# Altium project DT10965_MOTOR_CONTROLLER.PrjPcb (part 3 of 8)

## Sheet Accelerometers.SchDoc: =DT_SCH_Title
size A4; Organization: Droid Technologies; DocumentNumber: DT10965; Revision: 1.0; SheetNumber: 9; SheetTotal: 22
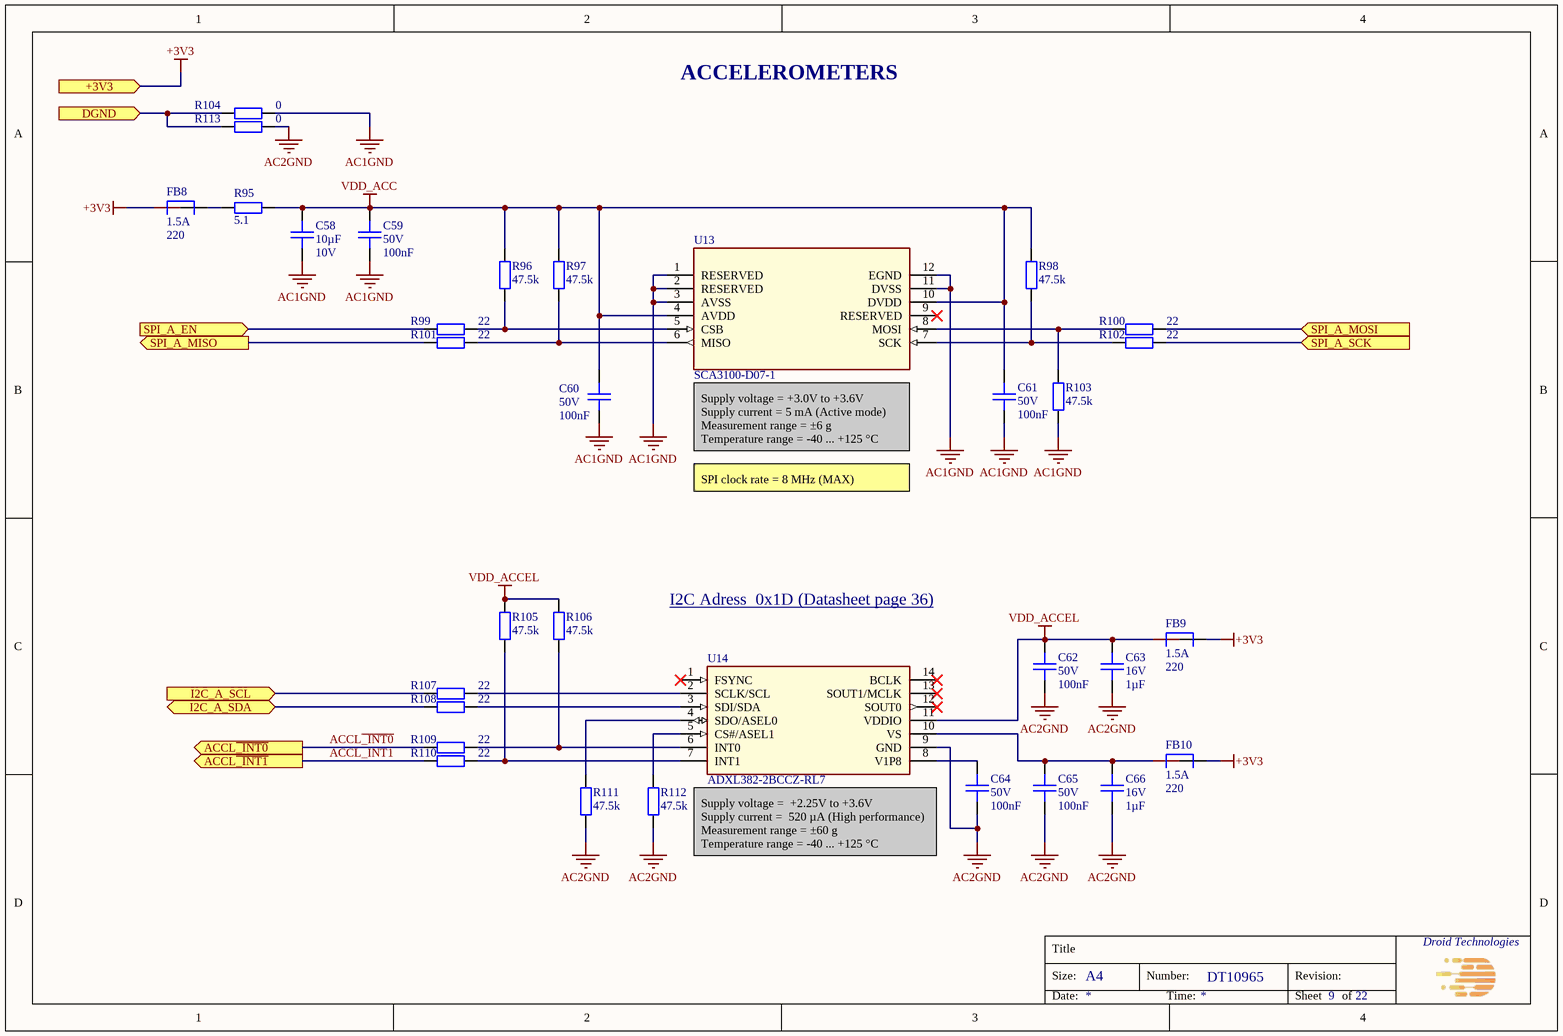
[diagram p7: Accelerometers.SchDoc]

### Parts
C58  Capacitance: 10µF  Voltage Rating: 10V  [CAPC200X125X145L50]  (hidden comment: CGA4J1X8L1A106K125AC)
C59  Voltage Rating: 50V  Capacitance: 100nF  [CAPC100x50x50L25]  (hidden comment: GCM155L8EH104KE07D)
C60  Voltage Rating: 50V  Capacitance: 100nF  [CAPC100x50x50L25]  (hidden comment: GCM155L8EH104KE07D)
C61  Voltage Rating: 50V  Capacitance: 100nF  [CAPC100x50x50L25]  (hidden comment: GCM155L8EH104KE07D)
C62  Voltage Rating: 50V  Capacitance: 100nF  [CAPC100x50x50L25]  (hidden comment: GCM155L8EH104KE07D)
C63  Voltage Rating: 16V  Capacitance: 1µF  [CAPC160X80X90L35]  (hidden comment: GCG188L8EE105KA07D)
C64  Voltage Rating: 50V  Capacitance: 100nF  [CAPC100x50x50L25]  (hidden comment: GCM155L8EH104KE07D)
C65  Voltage Rating: 50V  Capacitance: 100nF  [CAPC100x50x50L25]  (hidden comment: GCM155L8EH104KE07D)
C66  Voltage Rating: 16V  Capacitance: 1µF  [CAPC160X80X90L35]  (hidden comment: GCG188L8EE105KA07D)
FB8  Imax: 1.5A  Impedance: 220  [BEADC160X80X95L40]  (hidden comment: BLM18KG221BH1D)
FB9  Imax: 1.5A  Impedance: 220  [BEADC160X80X95L40]  (hidden comment: BLM18KG221BH1D)
FB10  Imax: 1.5A  Impedance: 220  [BEADC160X80X95L40]  (hidden comment: BLM18KG221BH1D)
R95  Resistance: 5.1  [RESC100X50X40L25]  (hidden comment: RC0402FR-075R1L)
R96  Resistance: 47.5k  [RESC100X50X40L25]  (hidden comment: RC0402FR-0747K5L)
R97  Resistance: 47.5k  [RESC100X50X40L25]  (hidden comment: RC0402FR-0747K5L)
R98  Resistance: 47.5k  [RESC100X50X40L25]  (hidden comment: RC0402FR-0747K5L)
R99  Resistance: 22  [RESC100X50X40L25]  (hidden comment: RC0402FR-0722RL)
R100  Resistance: 22  [RESC100X50X40L25]  (hidden comment: RC0402FR-0722RL)
R101  Resistance: 22  [RESC100X50X40L25]  (hidden comment: RC0402FR-0722RL)
R102  Resistance: 22  [RESC100X50X40L25]  (hidden comment: RC0402FR-0722RL)
R103  Resistance: 47.5k  [RESC100X50X40L25]  (hidden comment: RC0402FR-0747K5L)
R104  Resistance: 0  [RESC160X80X55L30]  (hidden comment: RC0603FR-070RL)
R105  Resistance: 47.5k  [RESC100X50X40L25]  (hidden comment: RC0402FR-0747K5L)
R106  Resistance: 47.5k  [RESC100X50X40L25]  (hidden comment: RC0402FR-0747K5L)
R107  Resistance: 22  [RESC100X50X40L25]  (hidden comment: RC0402FR-0722RL)
R108  Resistance: 22  [RESC100X50X40L25]  (hidden comment: RC0402FR-0722RL)
R109  Resistance: 22  [RESC100X50X40L25]  (hidden comment: RC0402FR-0722RL)
R110  Resistance: 22  [RESC100X50X40L25]  (hidden comment: RC0402FR-0722RL)
R111  Resistance: 47.5k  [RESC100X50X40L25]  (hidden comment: RC0402FR-0747K5L)
R112  Resistance: 47.5k  [RESC100X50X40L25]  (hidden comment: RC0402FR-0747K5L)
R113  Resistance: 0  [RESC160X80X55L30]  (hidden comment: RC0603FR-070RL)
U13  SCA3100-D07-1  [SCA3100-D07-1]
U14  ADXL382-2BCCZ-RL7  [14-LGA (2.9x2.8)]

### Ports
+3V3 (in), ACCL~{_INT0} (out), ACCL~{_INT1} (out), DGND (in), I2C_A_SCL (in), I2C_A_SDA (bidir), SPI_A_EN (in), SPI_A_MISO (out), SPI_A_MOSI (in), SPI_A_SCK (in)

### Nets
+3V3: FB8.1 FB9.2 FB10.2 ; port +3V3
AC1GND: C58.1 C59.1 C60.1 C61.1 R103.1 R104.1 U13.1(RESERVED) U13.2(RESERVED) U13.3(AVSS) U13.11(DVSS) U13.12(EGND)
AC2GND: C62.1 C63.1 C64.1 C65.1 C66.1 R111.1 R112.1 R113.1 U14.9(GND)
DGND: R104.2 R113.2 ; port DGND
VDD_ACC: C58.2 C59.2 C60.2 C61.2 R95.2 R96.2 R97.2 R98.2 U13.4(AVDD) U13.10(DVDD)
VDD_ACCEL: C62.2 C63.2 FB9.1 R105.2 R106.2 U14.11(VDDIO)
ACCL~{_INT0}: R109.1 ; port ACCL~{_INT0}
ACCL~{_INT1}: R110.1 ; port ACCL~{_INT1}
I2C_A_SCL: R107.1 ; port I2C_A_SCL
I2C_A_SDA: R108.1 ; port I2C_A_SDA
SPI_A_EN: R99.1 ; port SPI_A_EN
SPI_A_MISO: R101.1 ; port SPI_A_MISO
SPI_A_MOSI: R100.2 ; port SPI_A_MOSI
SPI_A_SCK: R102.2 ; port SPI_A_SCK
NetC64_2: C64.2 U14.8(V1P8)
NetC65_2: C65.2 C66.2 FB10.1 U14.10(VS)
NetFB8_2: FB8.2 R95.1
NetR96_1: R96.1 R99.2 U13.5(CSB)
NetR97_1: R97.1 R101.2 U13.6(MISO)
NetR98_1: R98.1 R102.1 U13.7(SCK)
NetR100_1: R100.1 R103.2 U13.8(MOSI)
NetR105_1: R105.1 R110.2 U14.7(INT1)
NetR106_1: R106.1 R109.2 U14.6(INT0)
NetR107_2: R107.2 U14.2(SCLK/SCL)
NetR108_2: R108.2 U14.3(SDI/SDA)
NetR111_2: R111.2 U14.4(SDO/ASEL0)
NetR112_2: R112.2 U14.5(CS#/ASEL1)

Not connected (* = marked no-connect by the designer): U13 9(RESERVED)*; U14 1(FSYNC)* 12(SOUT0)* 13(SOUT1/MCLK)* 14(BCLK)*

### Notes on the sheet
- ACCELEROMETERS
- (near U13) Supply voltage = +3.0V to +3.6V
  Supply current = 5 mA (Active mode)
  Measurement range = ±6 g
  Temperature range = -40 ... +125 °C
- SPI clock rate = 8 MHz (MAX)
- I2C Adress  0x1D (Datasheet page 36) <https://www.analog.com/media/en/technical-documentation/data-sheets/adxl382.pdf>
- Supply voltage =  +2.25V to +3.6V
  Supply current =  520 µA (High performance)
  Measurement range = ±60 g
  Temperature range = -40 ... +125 °C
- Title
- Size:
- A4
- Number:
- Revision:
- Date:
- Time:
- Sheet
- of

### Library data of the parts
C58 = CMP-001-1984-2: CAP CER 10UF 10V X8L 0805; Manufacturer: TDK Corporation; Tolerance: 10%; Op Temp min: -55°C; Op Temp max: 150°C; ComponentLink3Description: Digikey; Mounting Type: SM; Ratings: AEC-Q200; ComponentLink1Description: Datasheet; ComponentLink3URL: https://www.digikey.com/en/products/detail/tdk-corporation/CGA4J1X8L1A106K125AC/9991388; Lead Spacing: 0mm; MPN: CGA4J1X8L1A106K125AC; Size: 2.00mm x 1.25mm; Height max: 1.5mm; ComponentLink2URL: https://eu.mouser.com/ProductDetail/TDK/CGA4J1X8L1A106K125AC?qs=gZXFycFWdANzH%252B2UvJJjtQ%3D%3D; Package: 0805 (2012 Metric); ComponentLink2Description: Mouser; Dielectric: X8L; ComponentLink1URL: https://product.tdk.com/en/search/capacitor/ceramic/mlcc/info?part_no=CGA4J1X8L1A106K125AC
C59-C62 C64 C65 = CMP-001-1980-2: CAP CER 0.1UF 50V X8L 0402; Manufacturer: Murata Electronics; Op Temp max: 150°C; Op Temp min: -55°C; Tolerance: 10%; Height max: 550µm; ComponentLink3Description: Digikey; Mounting Type: SM; ComponentLink3URL: https://www.digikey.com/en/products/detail/murata-electronics/GCM155L8EH104KE07D/11618823; Package: 0402 (1005 Metric); Lead Spacing: 0mm; MPN: GCM155L8EH104KE07D; Size: 1.00mm x 0.50mm; Ratings: AEC-Q200; ComponentLink1URL: https://www.murata.com/en-us/products/productdetail?partno=GCM155L8EH104KE07%23; ComponentLink1Description: Datasheet; Dielectric: X8L; ComponentLink2Description: Mouser; ComponentLink2URL: https://eu.mouser.com/ProductDetail/Murata-Electronics/GCM155L8EH104KE07D?qs=1mbolxNpo8fQSHf0HYnZWw%3D%3D
C63 C66 = CMP-001-1982-2: CAP CER 1UF 16V X8L 0603; Manufacturer: Murata Electronics; Tolerance: 10%; Op Temp min: -55°C; Op Temp max: 150°C; ComponentLink3URL: https://www.digikey.com/en/products/detail/murata-electronics/GCG188L8EE105KA07D/10695125; Package: 0603 (1608 Metric); MPN: GCG188L8EE105KA07D; ComponentLink2URL: https://eu.mouser.com/ProductDetail/Murata-Electronics/GCG188L8EE105KA07D?qs=rrS6PyfT74dFMfTR80dVTA%3D%3D; Dielectric: X8L; Size: 1.60mm x 0.80mm; ComponentLink1Description: Datasheet; ComponentLink1URL: https://www.murata.com/en-us/products/productdetail?partno=GCG188L8EE105KA07%23; ComponentLink2Description: Mouser; Height max: 900µm; Mounting Type: SM; ComponentLink3Description: Digikey; Lead Spacing: 0mm; Ratings: AEC-Q200
FB8-FB10 = CMP-001-1981-1: FERRITE BEAD 220 OHM 0603 1LN; Manufacturer: Murata Electronics; DCR: 50m; Op Temp min: -55°C; Frequency: 100MHz; Op Temp max: 150°C; Number of Lines: 1; Mounting Type: SM; Size: 1.60mm x 0.80mm; ComponentLink2URL: https://eu.mouser.com/ProductDetail/Murata-Electronics/BLM18KG221BH1D?qs=sJ5gq5MLFXpgEHYBdWUtkQ%3D%3D; ComponentLink1Description: Datasheet; ComponentLink1URL: https://www.murata.com/en-us/products/productdata/8798137286686/QNFA9129.pdf; Lead Spacing: 0mm; Ratings: AEC-Q200; ComponentLink3Description: Digikey; ComponentLink3URL: https://www.digikey.com/en/products/detail/murata-electronics/BLM18KG221BH1D/6156000; Height max: 950µm; Package: 0603 (1608 Metric); ComponentLink2Description: Mouser; MPN: BLM18KG221BH1D
R95 = CMP-00125-8: RES 5.1 OHM 1% 1/16W 0402; Manufacturer: YAGEO; Power: 63mW; Temperature Coefficient: ±200ppm; Op Temp max: 155°C; Op Temp min: -55°C; ComponentLink3URL: https://www.digikey.com/en/products/detail/yageo/RC0402FR-075R1L/5917722; ComponentLink2Description: Mouser; ComponentLink2URL: https://eu.mouser.com/ProductDetail/YAGEO/RC0402FR-075R1L?qs=%2Fha2pyFaduhjtLcYvKXQ8B9EFTm6YmMloHxcmTFokS12j5yrT26S1A%3D%3D; Size: 1.00mm x 0.50mm; ComponentLink3Description: Digikey; Package: 0402 (1005 Metric); Ratings: -; Tolerance: 1%; MPN: RC0402FR-075R1L; ComponentLink1URL: https://www.yageo.com/upload/media/product/productsearch/datasheet/rchip/PYu-RC_Group_51_RoHS_L_12.pdf; Mounting Type: SM; Composition: Thick Film; Height max: 400µm; ComponentLink1Description: Datasheet
R96-R98 R103 R105 R106 R111 R112 = CMP-001-0277-7: RES 47.5K OHM 1% 1/16W 0402; Manufacturer: YAGEO; Op Temp min: -55°C; Power: 63mW; Temperature Coefficient: ±100ppm; Op Temp max: 155°C; ComponentLink1URL: https://www.yageo.com/upload/media/product/productsearch/datasheet/rchip/PYu-RC_Group_51_RoHS_L_12.pdf; ComponentLink1Description: Datasheet; MPN: RC0402FR-0747K5L; ComponentLink3Description: Digikey; ComponentLink2URL: https://eu.mouser.com/ProductDetail/YAGEO/RC0402FR-0747K5L?qs=V1yeUXFNrklfu86Rfgihxg%3D%3D; Mounting Type: SM; Tolerance: 1%; Package: 0402 (1005 Metric); Height max: 400µm; ComponentLink2Description: Mouser; ComponentLink3URL: https://www.digikey.com/en/products/detail/yageo/RC0402FR-0747K5L/726617; Size: 1.00mm x 0.50mm; Composition: Thick Film; Ratings: -
R99-R102 R107-R110 = CMP-001-0482-4: RES 22 OHM 1% 1/16W 0402; Manufacturer: YAGEO; Temperature Coefficient: ±100ppm; Op Temp max: 155°C; Op Temp min: -55°C; Power: 63mW; Ratings: -; ComponentLink3URL: https://www.digikey.com/en/products/detail/yageo/RC0402FR-0722RL/726562; ComponentLink2URL: https://eu.mouser.com/ProductDetail/YAGEO/RC0402FR-0722RL?qs=V1yeUXFNrkkRg6zf08ADKQ%3D%3D; MPN: RC0402FR-0722RL; ComponentLink1Description: Datasheet; ComponentLink3Description: Digikey; Tolerance: 1%; Size: 1.00mm x 0.50mm; ComponentLink1URL: https://www.yageo.com/upload/media/product/productsearch/datasheet/rchip/PYu-RC_Group_51_RoHS_L_12.pdf; Composition: Thick Film; ComponentLink2Description: Mouser; Mounting Type: SM; Package: 0402 (1005 Metric); Height max: 400µm
R104 R113 = CMP-001-0927-2: RES 0 OHM JUMPER 1/10W 0603; Manufacturer: YAGEO; Op Temp min: -55°C; Op Temp max: 155°C; Power: 100mW; Tolerance: 0%; Height max: 550µm; ComponentLink2URL: https://eu.mouser.com/ProductDetail/YAGEO/RC0603FR-070RL?qs=0yPvnVz5%2FmpDQv43TwvCfw%3D%3D; Temperature Coefficient: -; ComponentLink3Description: Digikey; ComponentLink2Description: Mouser; MPN: RC0603FR-070RL; ComponentLink1URL: https://www.yageo.com/upload/media/product/productsearch/datasheet/rchip/PYu-RC_Group_51_RoHS_L_12.pdf; Ratings: -; Size: 1.60mm x 0.80mm; Composition: Thick Film; Mounting Type: SM; ComponentLink3URL: https://www.digikey.com/en/products/detail/yageo/RC0603FR-070RL/1304008; Package: 0603 (1608 Metric); ComponentLink1Description: Datasheet
U13 = SCA3100-D07-1: ACCELEROMETER 6G SPI 12SMD; Manufacturer: Murata Electronics; MPN: SCA3100-D07-1
U14 = ADXL382-2BCCZ-RL7: Accelerometer X, Y, Z Axis ±15g, 30g, 60g 50Hz ~ 8kHz 14-LGA (2.9x2.8); Manufacturer: Analog Devices Inc.; MPN: ADXL382-2BCCZ-RL7

## Sheet H-bridge.SchDoc: =DT_SCH_Title
size A4; Organization: Droid Technologies; DocumentNumber: DT10965; Revision: 1.0; SheetNumber: 10; SheetTotal: 22
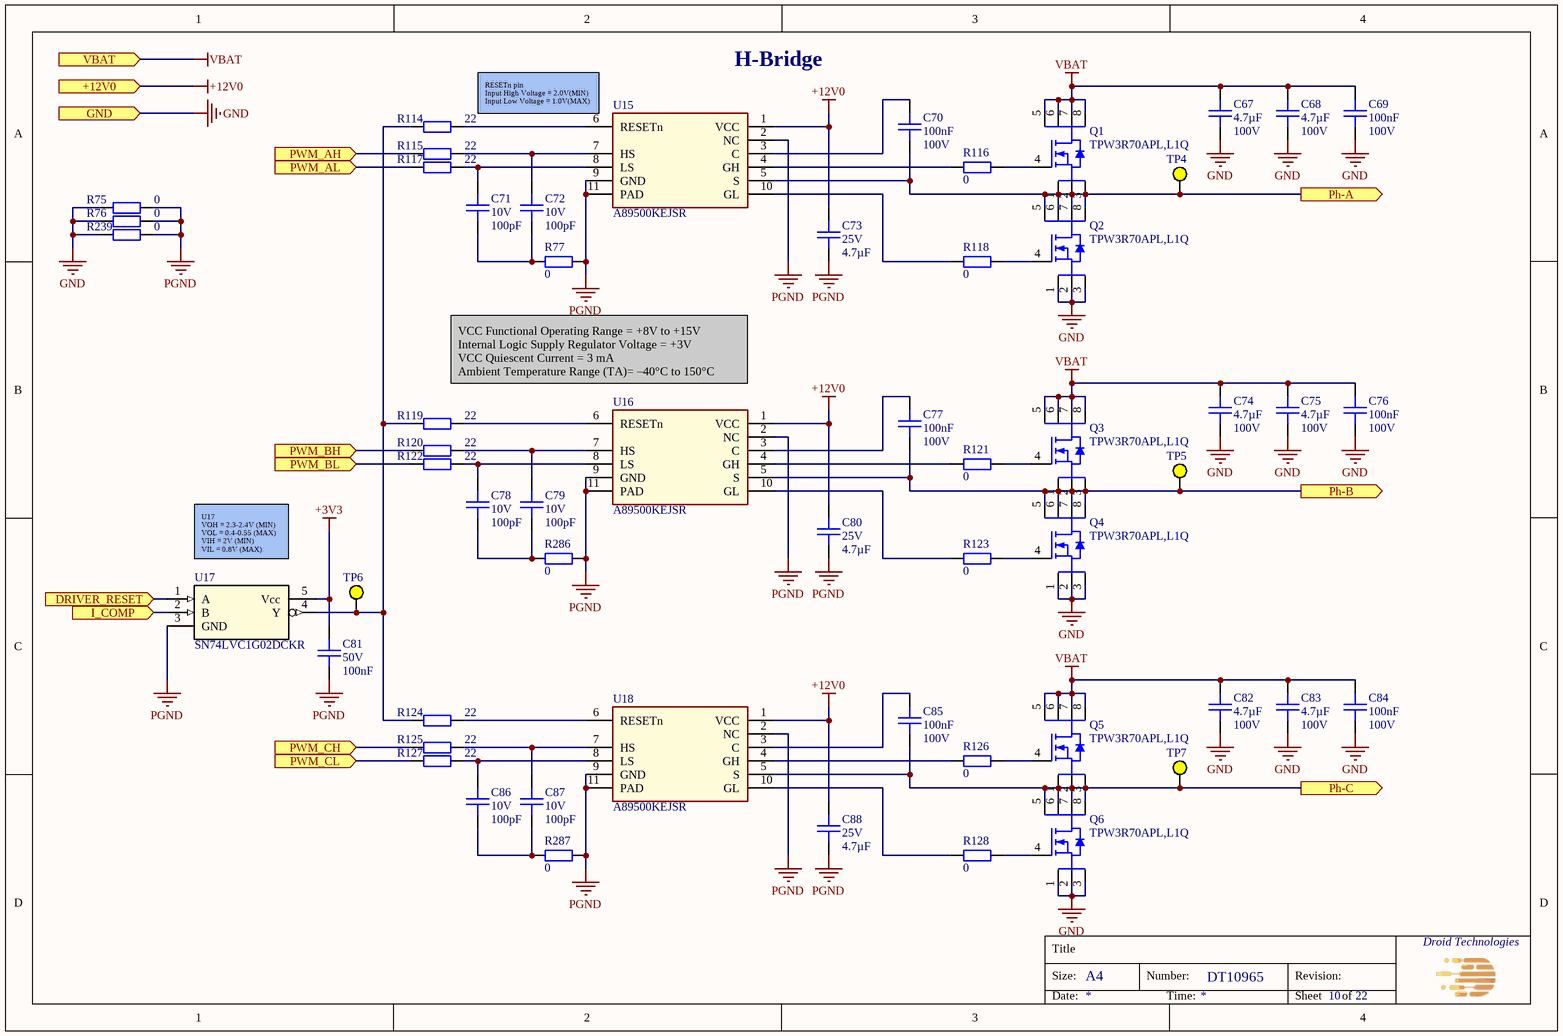
[diagram p8: H-bridge.SchDoc]

### Parts
C67  Capacitance: 4.7µF  Voltage Rating: 100V  [CAPC320X250X250L60]  (hidden comment: CL32E475KCIVPJE)
C68  Capacitance: 4.7µF  Voltage Rating: 100V  [CAPC320X250X250L60]  (hidden comment: CL32E475KCIVPJE)
C69  Capacitance: 100nF  Voltage Rating: 100V  [CAPC160X80X90L35]  (hidden comment: GCJ188L8EL104KA07D)
C70  Capacitance: 100nF  Voltage Rating: 100V  [CAPC160X80X90L35]  (hidden comment: GCJ188L8EL104KA07D)
C71  Voltage Rating: 10V  Capacitance: 100pF  [CAPC160X80X90L35]  (hidden comment: C0603C101K8HACAUTO)
C72  Voltage Rating: 10V  Capacitance: 100pF  [CAPC160X80X90L35]  (hidden comment: C0603C101K8HACAUTO)
C73  Voltage Rating: 25V  Capacitance: 4.7µF  [CAPC200X125X145L50]  (hidden comment: CGA4J1X8L1E475K125AC)
C74  Capacitance: 4.7µF  Voltage Rating: 100V  [CAPC320X250X250L60]  (hidden comment: CL32E475KCIVPJE)
C75  Capacitance: 4.7µF  Voltage Rating: 100V  [CAPC320X250X250L60]  (hidden comment: CL32E475KCIVPJE)
C76  Capacitance: 100nF  Voltage Rating: 100V  [CAPC160X80X90L35]  (hidden comment: GCJ188L8EL104KA07D)
C77  Capacitance: 100nF  Voltage Rating: 100V  [CAPC160X80X90L35]  (hidden comment: GCJ188L8EL104KA07D)
C78  Voltage Rating: 10V  Capacitance: 100pF  [CAPC160X80X90L35]  (hidden comment: C0603C101K8HACAUTO)
C79  Voltage Rating: 10V  Capacitance: 100pF  [CAPC160X80X90L35]  (hidden comment: C0603C101K8HACAUTO)
C80  Voltage Rating: 25V  Capacitance: 4.7µF  [CAPC200X125X145L50]  (hidden comment: CGA4J1X8L1E475K125AC)
C81  Voltage Rating: 50V  Capacitance: 100nF  [CAPC100x50x50L25]  (hidden comment: GCM155L8EH104KE07D)
C82  Capacitance: 4.7µF  Voltage Rating: 100V  [CAPC320X250X250L60]  (hidden comment: CL32E475KCIVPJE)
C83  Capacitance: 4.7µF  Voltage Rating: 100V  [CAPC320X250X250L60]  (hidden comment: CL32E475KCIVPJE)
C84  Capacitance: 100nF  Voltage Rating: 100V  [CAPC160X80X90L35]  (hidden comment: GCJ188L8EL104KA07D)
C85  Capacitance: 100nF  Voltage Rating: 100V  [CAPC160X80X90L35]  (hidden comment: GCJ188L8EL104KA07D)
C86  Voltage Rating: 10V  Capacitance: 100pF  [CAPC160X80X90L35]  (hidden comment: C0603C101K8HACAUTO)
C87  Voltage Rating: 10V  Capacitance: 100pF  [CAPC160X80X90L35]  (hidden comment: C0603C101K8HACAUTO)
C88  Voltage Rating: 25V  Capacitance: 4.7µF  [CAPC200X125X145L50]  (hidden comment: CGA4J1X8L1E475K125AC)
Q1  TPW3R70APL,L1Q  [TOSHIBA_2-5Q1A]
Q2  TPW3R70APL,L1Q  [TOSHIBA_2-5Q1A]
Q3  TPW3R70APL,L1Q  [TOSHIBA_2-5Q1A]
Q4  TPW3R70APL,L1Q  [TOSHIBA_2-5Q1A]
Q5  TPW3R70APL,L1Q  [TOSHIBA_2-5Q1A]
Q6  TPW3R70APL,L1Q  [TOSHIBA_2-5Q1A]
R75  Resistance: 0  [RESC160X80X55L30]  (hidden comment: RC0603FR-070RL)
R76  Resistance: 0  [RESC160X80X55L30]  (hidden comment: RC0603FR-070RL)
R77  Resistance: 0  [RESC160X80X55L30]  (hidden comment: RC0603FR-070RL)
R114  Resistance: 22  [RESC100X50X40L25]  (hidden comment: RC0402FR-0722RL)
R115  Resistance: 22  [RESC100X50X40L25]  (hidden comment: RC0402FR-0722RL)
R116  Resistance: 0  [RESC160X80X55L30]  (hidden comment: RC0603FR-070RL)
R117  Resistance: 22  [RESC100X50X40L25]  (hidden comment: RC0402FR-0722RL)
R118  Resistance: 0  [RESC160X80X55L30]  (hidden comment: RC0603FR-070RL)
R119  Resistance: 22  [RESC100X50X40L25]  (hidden comment: RC0402FR-0722RL)
R120  Resistance: 22  [RESC100X50X40L25]  (hidden comment: RC0402FR-0722RL)
R121  Resistance: 0  [RESC160X80X55L30]  (hidden comment: RC0603FR-070RL)
R122  Resistance: 22  [RESC100X50X40L25]  (hidden comment: RC0402FR-0722RL)
R123  Resistance: 0  [RESC160X80X55L30]  (hidden comment: RC0603FR-070RL)
R124  Resistance: 22  [RESC100X50X40L25]  (hidden comment: RC0402FR-0722RL)
R125  Resistance: 22  [RESC100X50X40L25]  (hidden comment: RC0402FR-0722RL)
R126  Resistance: 0  [RESC160X80X55L30]  (hidden comment: RC0603FR-070RL)
R127  Resistance: 22  [RESC100X50X40L25]  (hidden comment: RC0402FR-0722RL)
R128  Resistance: 0  [RESC160X80X55L30]  (hidden comment: RC0603FR-070RL)
R239  Resistance: 0  [RESC160X80X55L30]  (hidden comment: RC0603FR-070RL)
R286  Resistance: 0  [RESC160X80X55L30]  (hidden comment: RC0603FR-070RL)
R287  Resistance: 0  [RESC160X80X55L30]  (hidden comment: RC0603FR-070RL)
TP4  Test Point  [TP_D0.75mm]  (value not drawn)  (no BOM)
TP5  Test Point  [TP_D0.75mm]  (value not drawn)  (no BOM)
TP6  Test Point  [TP_D0.75mm]  (value not drawn)  (no BOM)
TP7  Test Point  [TP_D0.75mm]  (value not drawn)  (no BOM)
U15  A89500KEJSR  [A89500KEJSR]
U16  A89500KEJSR  [A89500KEJSR]
U17  SN74LVC1G02DCKR  [DCK0005A_N]
U18  A89500KEJSR  [A89500KEJSR]

### Ports
+12V0 (in), DRIVER_RESET (in), GND (in), I_COMP (in), Ph-A (out), Ph-B (out), Ph-C (out), PWM_AH (in), PWM_AL (in), PWM_BH (in), PWM_BL (in), PWM_CH (in), PWM_CL (in), VBAT (in)

### Nets
+3V3: C81.2 U17.5(Vcc)
+12V0: C73.2 C80.2 C88.2 U15.1(VCC) U16.1(VCC) U18.1(VCC) ; port +12V0
GND: C67.1 C68.1 C69.1 C74.1 C75.1 C76.1 C82.1 C83.1 C84.1 Q2.1 Q2.2 Q2.3 Q4.1 Q4.2 Q4.3 Q6.1 Q6.2 Q6.3 R75.2 R76.2 R239.2 ; port GND
PGND: C73.1 C80.1 C81.1 C88.1 R75.1 R76.1 R77.2 R239.1 R286.2 R287.2 U15.2(NC) U15.9(GND) U15.11(PAD) U16.2(NC) U16.9(GND) U16.11(PAD) U17.3(GND) U18.2(NC) U18.9(GND) U18.11(PAD)
VBAT: C67.2 C68.2 C69.2 C74.2 C75.2 C76.2 C82.2 C83.2 C84.2 Q1.5 Q1.6 Q1.7 Q1.8 Q3.5 Q3.6 Q3.7 Q3.8 Q5.5 Q5.6 Q5.7 Q5.8 ; port VBAT
I_COMP: U17.2(B) ; port I_COMP
NetC70_1: C70.1 Q1.1 Q1.2 Q1.3 Q2.5 Q2.6 Q2.7 Q2.8 TP4.1 U15.5(S) ; port Ph-A
NetC70_2: C70.2 U15.3(C)
NetC71_1: C71.1 C72.1 R77.1
NetC71_2: C71.2 R117.2 U15.8(LS)
NetC72_2: C72.2 R115.2 U15.7(HS)
NetC77_1: C77.1 Q3.1 Q3.2 Q3.3 Q4.5 Q4.6 Q4.7 Q4.8 TP5.1 U16.5(S) ; port Ph-B
NetC77_2: C77.2 U16.3(C)
NetC78_1: C78.1 C79.1 R286.1
NetC78_2: C78.2 R122.2 U16.8(LS)
NetC79_2: C79.2 R120.2 U16.7(HS)
NetC85_1: C85.1 Q5.1 Q5.2 Q5.3 Q6.5 Q6.6 Q6.7 Q6.8 TP7.1 U18.5(S) ; port Ph-C
NetC85_2: C85.2 U18.3(C)
NetC86_1: C86.1 C87.1 R287.1
NetC86_2: C86.2 R127.2 U18.8(LS)
NetC87_2: C87.2 R125.2 U18.7(HS)
NetQ1_4: Q1.4 R116.2
NetQ2_4: Q2.4 R118.2
NetQ3_4: Q3.4 R121.2
NetQ4_4: Q4.4 R123.2
NetQ5_4: Q5.4 R126.2
NetQ6_4: Q6.4 R128.2
NetR114_1: R114.1 R119.1 R124.1 TP6.1 U17.4(Y)
NetR114_2: R114.2 U15.6(RESETn)
NetR115_1: R115.1 ; port PWM_AH
NetR116_1: R116.1 U15.4(GH)
NetR117_1: R117.1 ; port PWM_AL
NetR118_1: R118.1 U15.10(GL)
NetR119_2: R119.2 U16.6(RESETn)
NetR120_1: R120.1 ; port PWM_BH
NetR121_1: R121.1 U16.4(GH)
NetR122_1: R122.1 ; port PWM_BL
NetR123_1: R123.1 U16.10(GL)
NetR124_2: R124.2 U18.6(RESETn)
NetR125_1: R125.1 ; port PWM_CH
NetR126_1: R126.1 U18.4(GH)
NetR127_1: R127.1 ; port PWM_CL
NetR128_1: R128.1 U18.10(GL)
NetU1_93: U17.1(A) ; port DRIVER_RESET

### Notes on the sheet
- RESETn pin
  Input High Voltage = 2.0V(MIN)
  Input Low Voltage = 1.0V(MAX)
- H-Bridge
- VCC Functional Operating Range = +8V to +15V
  Internal Logic Supply Regulator Voltage = +3V
  VCC Quiescent Current = 3 mA
  Ambient Temperature Range (TA)= –40°C to 150°C
- (near U17) U17
  VOH = 2.3-2.4V (MIN)
  VOL = 0.4-0.55 (MAX)
  VIH = 2V (MIN)
  VIL = 0.8V (MAX)
- Title
- Size:
- A4
- Number:
- Revision:
- Date:
- Time:
- Sheet
- of

### Library data of the parts
C67 C68 C74 C75 C82 C83 = CMP-001-2005-2: CAP CER 4.7UF 100V X8L 1210; Manufacturer: Samsung Electro-Mechanics; Op Temp min: -55°C; Tolerance: 10%; Op Temp max: 150°C; Lead Spacing: 0mm; ComponentLink3Description: Digikey; ComponentLink1Description: Datasheet; ComponentLink3URL: https://www.digikey.com/en/products/detail/samsung-electro-mechanics/CL32E475KCIVPJE/20498500; Ratings: AEC-Q200; ComponentLink2URL: https://eu.mouser.com/ProductDetail/Samsung-Electro-Mechanics/CL32E475KCIVPJE?qs=Imq1NPwxi77B1%252BqSJu7fiA%3D%3D; ComponentLink1URL: https://product.samsungsem.com/mlcc/CL32E475KCIVPJ.do; MPN: CL32E475KCIVPJE; Mounting Type: SM; Size: 3.20mm x 2.50mm; Dielectric: X8L; ComponentLink2Description: Mouser; Package: 1210 (3225 Metric); Height max: 2.3mm
C69 C70 C76 C77 C84 C85 = CMP-001-2003-2: CAP CER 0.1UF 100V X8L 0603; Manufacturer: Murata Electronics; Tolerance: 10%; Op Temp min: -55°C; Op Temp max: 150°C; Package: 0603 (1608 Metric); ComponentLink3URL: https://www.digikey.com/en/products/detail/murata-electronics/GCJ188L8EL104KA07D/11618648; Lead Spacing: 0mm; ComponentLink1Description: Datasheet; ComponentLink1URL: https://www.murata.com/en-us/products/productdetail?partno=GCJ188L8EL104KA07%23; ComponentLink3Description: Digikey; MPN: GCJ188L8EL104KA07D; Ratings: AEC-Q200; ComponentLink2Description: Mouser; Height max: 900µm; Dielectric: X8L; Mounting Type: SM; ComponentLink2URL: https://eu.mouser.com/ProductDetail/Murata-Electronics/GCJ188L8EL104KA07D?qs=rrS6PyfT74fTpbPMbkPm2A%3D%3D; Size: 1.60mm x 0.80mm
C71 C72 C78 C79 C86 C87 = CMP-001-2002-2: CAP CER 0603 100PF 10V ULTRA STA; Manufacturer: KEMET; Dielectric: X8R; Op Temp max: 150°C; Op Temp min: -55°C; Tolerance: 10%; ComponentLink2Description: Mouser; Height max: 870µm; ComponentLink3Description: Digikey; ComponentLink3URL: https://www.digikey.com/en/products/detail/kemet/C0603C101K8HACAUTO/7957168; ComponentLink2URL: https://eu.mouser.com/ProductDetail/KEMET/C0603C101K8HACAUTO?qs=j%252B1pi9TdxUaad%2FlKIn1CPA%3D%3D; Lead Spacing: 0mm; Package: 0603 (1608 Metric); MPN: C0603C101K8HACAUTO; Mounting Type: SM; ComponentLink1URL: https://www.kemet.com/en/us/product/C0603C101K8HACAUTO.html; Ratings: AEC-Q200; Size: 1.60mm x 0.80mm; ComponentLink1Description: Datasheet
C73 C80 C88 = CMP-001-2004-3: CAP CER 4.7UF 25V X8L 0805; Manufacturer: TDK Corporation; Op Temp max: 150°C; Op Temp min: -55°C; Tolerance: 10%; ComponentLink1URL: https://product.tdk.com/en/search/capacitor/ceramic/mlcc/info?part_no=CGA4J1X8L1E475K125AC; Package: 0805 (2012 Metric); Size: 2.00mm x 1.25mm; Height max: 1.5mm; Lead Spacing: 0mm; Ratings: AEC-Q200; ComponentLink1Description: Datasheet; ComponentLink3Description: Digikey; MPN: CGA4J1X8L1E475K125AC; Mounting Type: SM; ComponentLink2URL: https://eu.mouser.com/ProductDetail/TDK/CGA4J1X8L1E475K125AC?qs=gZXFycFWdANxpKJOMQuJTA%3D%3D; ComponentLink3URL: https://www.digikey.com/en/products/detail/tdk-corporation/CGA4J1X8L1E475K125AC/9991390; ComponentLink2Description: Mouser; Dielectric: X8L
C81 = CMP-001-1980-2: as C59-C62 on sheet Accelerometers; Height max: 550µm; ComponentLink3Description: Digikey; Mounting Type: SM; ComponentLink3URL: https://www.digikey.com/en/products/detail/murata-electronics/GCM155L8EH104KE07D/11618823; Package: 0402 (1005 Metric); Lead Spacing: 0mm; MPN: GCM155L8EH104KE07D; Size: 1.00mm x 0.50mm; Ratings: AEC-Q200; ComponentLink1URL: https://www.murata.com/en-us/products/productdetail?partno=GCM155L8EH104KE07%23; ComponentLink1Description: Datasheet; Dielectric: X8L; ComponentLink2Description: Mouser; ComponentLink2URL: https://eu.mouser.com/ProductDetail/Murata-Electronics/GCM155L8EH104KE07D?qs=1mbolxNpo8fQSHf0HYnZWw%3D%3D
Q1-Q6 = TPW3R70APL,L1Q: PB-F POWER MOSFET TRANSISTOR DSO; Manufacturer: Toshiba Semiconductor and Storage; MPN: TPW3R70APL,L1Q
R75-R77 R116 R118 R121 R123 R126 R128 R239 R286 R287 = CMP-001-0927-2: as R104 on sheet Accelerometers; Height max: 550µm; ComponentLink2URL: https://eu.mouser.com/ProductDetail/YAGEO/RC0603FR-070RL?qs=0yPvnVz5%2FmpDQv43TwvCfw%3D%3D; Temperature Coefficient: -; ComponentLink3Description: Digikey; ComponentLink2Description: Mouser; MPN: RC0603FR-070RL; ComponentLink1URL: https://www.yageo.com/upload/media/product/productsearch/datasheet/rchip/PYu-RC_Group_51_RoHS_L_12.pdf; Ratings: -; Size: 1.60mm x 0.80mm; Composition: Thick Film; Mounting Type: SM; ComponentLink3URL: https://www.digikey.com/en/products/detail/yageo/RC0603FR-070RL/1304008; Package: 0603 (1608 Metric); ComponentLink1Description: Datasheet
R114 R115 R117 R119 R120 R122 R124 R125 R127 = CMP-001-0482-4: as R99-R102 on sheet Accelerometers; Ratings: -; ComponentLink3URL: https://www.digikey.com/en/products/detail/yageo/RC0402FR-0722RL/726562; ComponentLink2URL: https://eu.mouser.com/ProductDetail/YAGEO/RC0402FR-0722RL?qs=V1yeUXFNrkkRg6zf08ADKQ%3D%3D; MPN: RC0402FR-0722RL; ComponentLink1Description: Datasheet; ComponentLink3Description: Digikey; Tolerance: 1%; Size: 1.00mm x 0.50mm; ComponentLink1URL: https://www.yageo.com/upload/media/product/productsearch/datasheet/rchip/PYu-RC_Group_51_RoHS_L_12.pdf; Composition: Thick Film; ComponentLink2Description: Mouser; Mounting Type: SM; Package: 0402 (1005 Metric); Height max: 400µm
TP4-TP7 = TP_0.75: Test point 0.75mm
U15 U16 U18 = A89500KEJSR: IC GATE DRVR HALF-BRIDGE 10DFN; Manufacturer: Allegro MicroSystems; MPN: A89500KEJSR
U17 = IC_SN74LVC1G02DCKR: IC GATE NOR 1CH 2-INP SC70-5; Manufacturer: Texas Instruments; Logic Type: NOR Gate; Number of Circuits: 1; Current - Quiescent (Max): 10 µA; Current - Output High, Low: 32mA, 32mA; Voltage - Supply: 1.65V ~ 5.5V; Input Logic Level - Low: 0.7V ~ 0.8V; Input Logic Level - High: 1.7V ~ 2V; Max Propagation Delay @ V, Max CL: 4.5ns @ 5V, 50pF; Number of Inputs: 2; MPN: SN74LVC1G02DCKR; ComponentLink1Description: Datasheet; ComponentLink1URL: https://www.ti.com/lit/ds/symlink/sn74lvc1g02.pdf?HQS=dis-dk-null-digikeymode-dsf-pf-null-wwe&ts=1752995079783&ref_url=https%253A%252F%252Fwww.ti.com%252Fgeneral%252Fdocs%252Fsuppproductinfo.tsp%253FdistId%253D10%2526gotoUrl%253Dhttps%253A%252F%252Fwww.ti.com%252Flit%252Fgpn%252Fsn74lvc1g02; ComponentLink2Description: DigiKey; ComponentLink2URL: https://www.digikey.gr/en/products/detail/texas-instruments/SN74LVC1G02DCKR/385715; ComponentLink3Description: Mouser; ComponentLink3URL: https://eu.mouser.com/ProductDetail/Texas-Instruments/SN74LVC1G02DCKR?qs=HE9hdJajmerjAA9y3nGmcA%3D%3D; Operating Temperature (MIN): -40°C; Operating Temperature (MAX): +125°C; Mounting Type: SM; Package / Case: 5-TSSOP, SC-70-5, SOT-353

## Sheet Resolver.SchDoc: =DT_SCH_Title
size A4; Organization: Droid Technologies; DocumentNumber: DT10965; Revision: 1.0; SheetNumber: 12; SheetTotal: 22
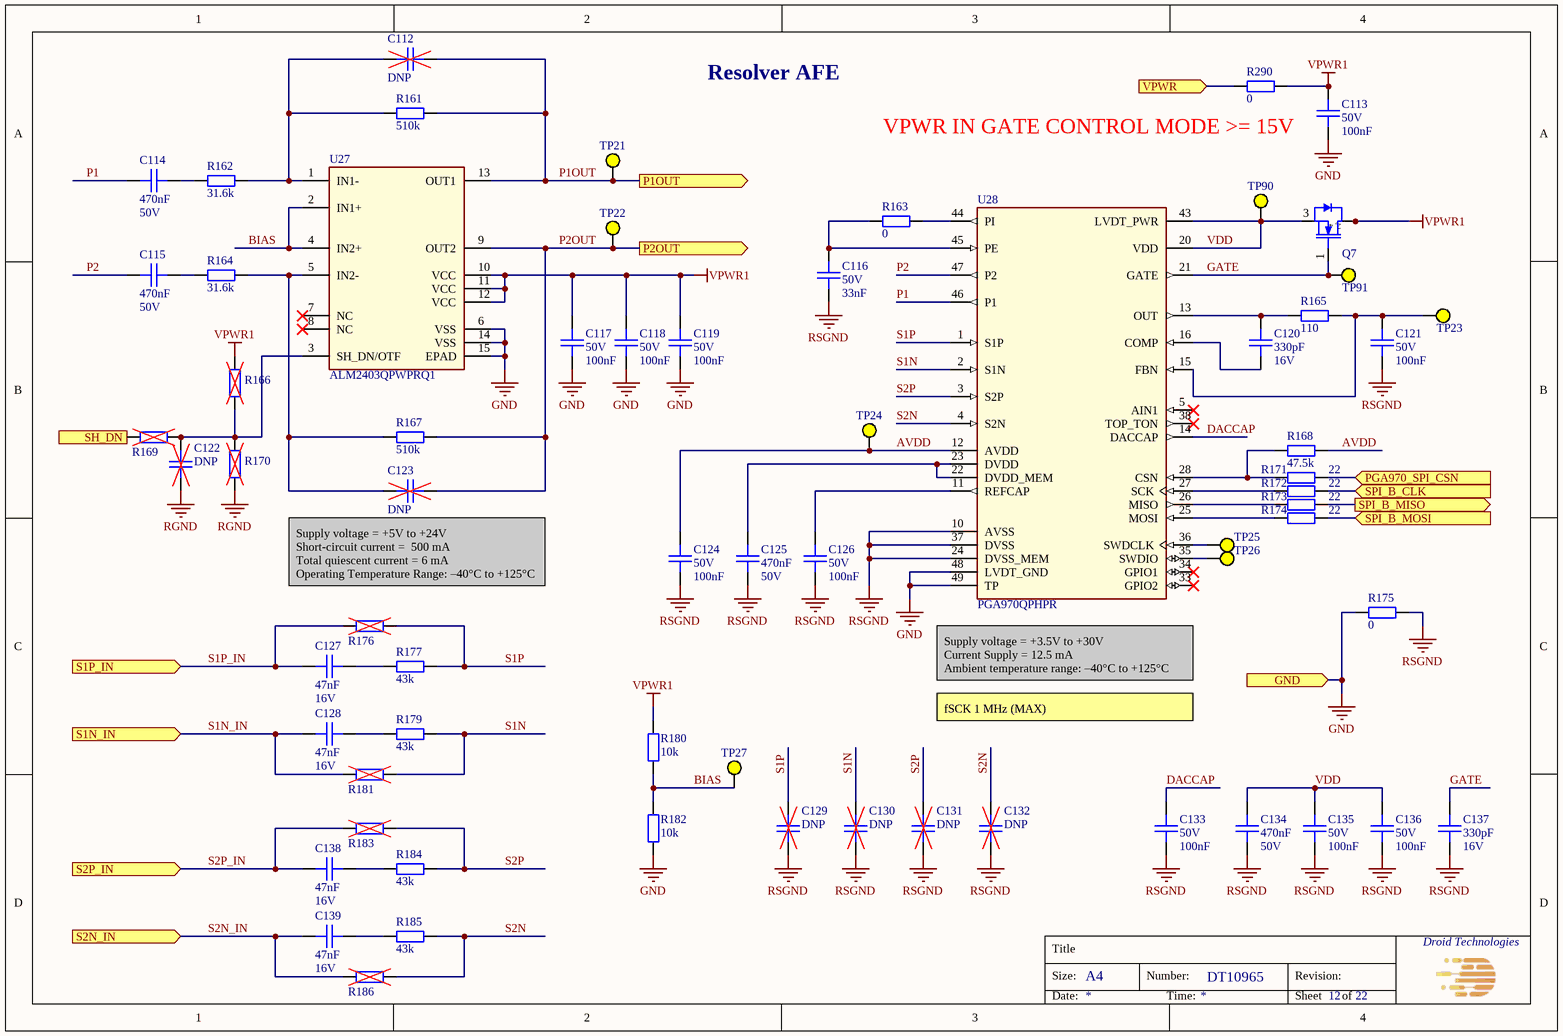
[diagram p9: Resolver.SchDoc]

### Parts
C112  Capacitance: DNP  [CAPC100x50x50L25]  (hidden comment: DNP chip cap 0402)
C113  Voltage Rating: 50V  Capacitance: 100nF  [CAPC100x50x50L25]  (hidden comment: GCM155L8EH104KE07D)
C114  Capacitance: 470nF  Voltage Rating: 50V  [CAPC200X125X145L50]  (hidden comment: CGA4J1X8L1H474K125AC)
C115  Capacitance: 470nF  Voltage Rating: 50V  [CAPC200X125X145L50]  (hidden comment: CGA4J1X8L1H474K125AC)
C116  Voltage Rating: 50V  Capacitance: 33nF  [CAPC100x50x50L25]  (hidden comment: GCM155L8EH333KE07D)
C117  Voltage Rating: 50V  Capacitance: 100nF  [CAPC100x50x50L25]  (hidden comment: GCM155L8EH104KE07D)
C118  Voltage Rating: 50V  Capacitance: 100nF  [CAPC100x50x50L25]  (hidden comment: GCM155L8EH104KE07D)
C119  Voltage Rating: 50V  Capacitance: 100nF  [CAPC100x50x50L25]  (hidden comment: GCM155L8EH104KE07D)
C120  Capacitance: 330pF  Voltage Rating: 16V  [CAPC160X80X90L35]  (hidden comment: C0603C331J4HACTU)
C121  Voltage Rating: 50V  Capacitance: 100nF  [CAPC100x50x50L25]  (hidden comment: GCM155L8EH104KE07D)
C122  Capacitance: DNP  [CAPC100x50x50L25]  (hidden comment: DNP chip cap 0402)
C123  Capacitance: DNP  [CAPC100x50x50L25]  (hidden comment: DNP chip cap 0402)
C124  Voltage Rating: 50V  Capacitance: 100nF  [CAPC100x50x50L25]  (hidden comment: GCM155L8EH104KE07D)
C125  Capacitance: 470nF  Voltage Rating: 50V  [CAPC200X125X145L50]  (hidden comment: CGA4J1X8L1H474K125AC)
C126  Voltage Rating: 50V  Capacitance: 100nF  [CAPC100x50x50L25]  (hidden comment: GCM155L8EH104KE07D)
C127  Capacitance: 47nF  Voltage Rating: 16V  [CAPC100x50x50L25]  (hidden comment: CGA2B3X8R1C473K050BB)
C128  Capacitance: 47nF  Voltage Rating: 16V  [CAPC100x50x50L25]  (hidden comment: CGA2B3X8R1C473K050BB)
C129  Capacitance: DNP  [CAPC100x50x50L25]  (hidden comment: DNP chip cap 0402)
C130  Capacitance: DNP  [CAPC100x50x50L25]  (hidden comment: DNP chip cap 0402)
C131  Capacitance: DNP  [CAPC100x50x50L25]  (hidden comment: DNP chip cap 0402)
C132  Capacitance: DNP  [CAPC100x50x50L25]  (hidden comment: DNP chip cap 0402)
C133  Voltage Rating: 50V  Capacitance: 100nF  [CAPC100x50x50L25]  (hidden comment: GCM155L8EH104KE07D)
C134  Capacitance: 470nF  Voltage Rating: 50V  [CAPC200X125X145L50]  (hidden comment: CGA4J1X8L1H474K125AC)
C135  Voltage Rating: 50V  Capacitance: 100nF  [CAPC100x50x50L25]  (hidden comment: GCM155L8EH104KE07D)
C136  Voltage Rating: 50V  Capacitance: 100nF  [CAPC100x50x50L25]  (hidden comment: GCM155L8EH104KE07D)
C137  Capacitance: 330pF  Voltage Rating: 16V  [CAPC160X80X90L35]  (hidden comment: C0603C331J4HACTU)
C138  Capacitance: 47nF  Voltage Rating: 16V  [CAPC100x50x50L25]  (hidden comment: CGA2B3X8R1C473K050BB)
C139  Capacitance: 47nF  Voltage Rating: 16V  [CAPC100x50x50L25]  (hidden comment: CGA2B3X8R1C473K050BB)
Q7  BSP129H6327XTSA1  [SOT230P700X180-4N]  (value not drawn)
R161  Resistance: 510k  [RESC100X50X40L25]  (hidden comment: RC0402FR-07510KL)
R162  Resistance: 31.6k  [RESC100X50X40L25]  (hidden comment: RC0402FR-0731K6L)
R163  Resistance: 0  [RESC160X80X55L30]  (hidden comment: RC0603FR-070RL)
R164  Resistance: 31.6k  [RESC100X50X40L25]  (hidden comment: RC0402FR-0731K6L)
R165  Resistance: 110  [RESC100X50X40L25]  (hidden comment: RC0402FR-07110RL)
R166  DNP chip res 0603  [RESC160X80X55L30]  (value not drawn)
R167  Resistance: 510k  [RESC100X50X40L25]  (hidden comment: RC0402FR-07510KL)
R168  Resistance: 47.5k  [RESC100X50X40L25]  (hidden comment: RC0402FR-0747K5L)
R169  DNP chip res 0603  [RESC160X80X55L30]  (value not drawn)
R170  DNP chip res 0603  [RESC160X80X55L30]  (value not drawn)
R171  Resistance: 22  [RESC100X50X40L25]  (hidden comment: RC0402FR-0722RL)
R172  Resistance: 22  [RESC100X50X40L25]  (hidden comment: RC0402FR-0722RL)
R173  Resistance: 22  [RESC100X50X40L25]  (hidden comment: RC0402FR-0722RL)
R174  Resistance: 22  [RESC100X50X40L25]  (hidden comment: RC0402FR-0722RL)
R175  Resistance: 0  [RESC160X80X55L30]  (hidden comment: RC0603FR-070RL)
R176  DNP chip res 0603  [RESC160X80X55L30]  (value not drawn)
R177  Resistance: 43k  [RESC100X50X40L25]  (hidden comment: RC0402FR-0743KL)
R179  Resistance: 43k  [RESC100X50X40L25]  (hidden comment: RC0402FR-0743KL)
R180  Resistance: 10k  [RESC100X50X40L25]  (hidden comment: RC0402FR-0710KL)
R181  DNP chip res 0603  [RESC160X80X55L30]  (value not drawn)
R182  Resistance: 10k  [RESC100X50X40L25]  (hidden comment: RC0402FR-0710KL)
R183  DNP chip res 0603  [RESC160X80X55L30]  (value not drawn)
R184  Resistance: 43k  [RESC100X50X40L25]  (hidden comment: RC0402FR-0743KL)
R185  Resistance: 43k  [RESC100X50X40L25]  (hidden comment: RC0402FR-0743KL)
R186  DNP chip res 0603  [RESC160X80X55L30]  (value not drawn)
R290  Resistance: 0  [RESC160X80X55L30]  (hidden comment: RC0603FR-070RL)
TP21  Test Point  [TP_D0.75mm]  (value not drawn)  (no BOM)
TP22  Test Point  [TP_D0.75mm]  (value not drawn)  (no BOM)
TP23  Test Point  [TP_D1.5mm]  (value not drawn)  (no BOM)
TP24  Test Point  [TP_D0.75mm]  (value not drawn)  (no BOM)
TP25  Test Point  [TP_D1.5mm]  (value not drawn)  (no BOM)
TP26  Test Point  [TP_D1.5mm]  (value not drawn)  (no BOM)
TP27  Test Point  [TP_D0.75mm]  (value not drawn)  (no BOM)
TP90  Test Point  [TP_D1.5mm]  (value not drawn)  (no BOM)
TP91  Test Point  [TP_D1.5mm]  (value not drawn)  (no BOM)
U27  ALM2403QPWPRQ1  [14-HTSSOP]
U28  PGA970QPHPR  [48-HTQFP (7x7)]

### Ports
GND (in), P1OUT (out), P2OUT (out), PGA970_SPI_CSN (in), S1N_IN (in), S1P_IN (in), S2N_IN (in), S2P_IN (in), SH_DN (out), SPI_B_CLK (in), SPI_B_MISO (out), SPI_B_MOSI (in), VPWR (in)

### Nets
GND: C113.1 C117.1 C118.1 C119.1 R175.2 R182.1 U27.6(VSS) U27.14(VSS) U27.15(EPAD) U28.48(LVDT_GND) U28.49(TP) ; port GND
RGND: C122.2 R170.1
RSGND: C116.1 C121.1 C124.1 C125.2 C126.1 C129.1 C130.1 C131.1 C132.1 C133.1 C134.2 C135.1 C136.1 C137.1 R175.1 U28.10(AVSS) U28.24(DVSS_MEM) U28.37(DVSS)
VPWR: R290.2 ; port VPWR
VPWR1: C113.2 C117.2 C118.2 C119.2 Q7.2(DRAIN) Q7.4(DRAIN) R166.2 R180.2 R290.1 U27.10(VCC) U27.11(VCC) U27.12(VCC)
AVDD: C124.2 R168.1 TP24.1 U28.12(AVDD)
BIAS: R180.1 R182.2 TP27.1 U27.2(IN1+) U27.4(IN2+)
DACCAP: C133.2 U28.14(DACCAP)
GATE: C137.2 Q7.1(GATE) TP91.1 U28.21(GATE)
P1: C114.2 U28.46(P1)
P1OUT: C112.1 R161.2 TP21.1 U27.13(OUT1) ; port P1OUT
P2: C115.2 U28.47(P2)
P2OUT: C123.1 R167.2 TP22.1 U27.9(OUT2) ; port P2OUT
S1N: C130.2 R179.2 R181.1 U28.2(S1N)
S1N_IN: C128.2 R181.2 ; port S1N_IN
S1P: C129.2 R176.1 R177.2 U28.1(S1P)
S1P_IN: C127.2 R176.2 ; port S1P_IN
S2N: C132.2 R185.2 R186.1 U28.4(S2N)
S2N_IN: C139.2 R186.2 ; port S2N_IN
S2P: C131.2 R183.1 R184.2 U28.3(S2P)
S2P_IN: C138.2 R183.2 ; port S2P_IN
SPI_B_CLK: R172.2 ; port SPI_B_CLK
SPI_B_MISO: R173.2 ; port SPI_B_MISO
SPI_B_MOSI: R174.2 ; port SPI_B_MOSI
VDD: C134.1 C135.2 C136.2 Q7.3(SOURCE) TP90.1 U28.20(VDD) U28.43(LVDT_PWR)
NetC112_2: C112.2 R161.1 R162.2 U27.1(IN1-)
NetC114_1: C114.1 R162.1
NetC115_1: C115.1 R164.1
NetC116_2: C116.2 R163.1 U28.45(PE)
NetC120_1: C120.1 U28.16(COMP)
NetC120_2: C120.2 R165.1 U28.13(OUT)
NetC121_2: C121.2 R165.2 TP23.1 U28.15(FBN)
NetC122_1: C122.1 R166.1 R169.1 R170.2 U27.3(SH_DN/OTF)
NetC123_2: C123.2 R164.2 R167.1 U27.5(IN2-)
NetC125_1: C125.1 U28.22(DVDD_MEM) U28.23(DVDD)
NetC126_2: C126.2 U28.11(REFCAP)
NetC127_1: C127.1 R177.1
NetC128_1: C128.1 R179.1
NetC138_1: C138.1 R184.1
NetC139_1: C139.1 R185.1
NetR163_2: R163.2 U28.44(PI)
NetR168_2: R168.2 R171.1 U28.28(CSN)
NetR169_2: R169.2 ; port SH_DN
NetR171_2: R171.2 ; port PGA970_SPI_CSN
NetR172_1: R172.1 U28.27(SCK)
NetR173_1: R173.1 U28.26(MISO)
NetR174_1: R174.1 U28.25(MOSI)
NetTP25_1: TP25.1 U28.36(SWDCLK)
NetTP26_1: TP26.1 U28.35(SWDIO)

Not connected (* = marked no-connect by the designer): U27 7(NC)* 8(NC)*; U28 5(AIN1)* 33(GPIO2)* 34(GPIO1)* 38(TOP_TON)*

### Notes on the sheet
- Resolver AFE
- (near R290) VPWR IN GATE CONTROL MODE >= 15V
- Supply voltage = +5V to +24V
  Short-circuit current =  500 mA
  Total quiescent current = 6 mA
  Operating Temperature Range: –40°C to +125°C
- (near U28) Supply voltage = +3.5V to +30V
  Current Supply = 12.5 mA
  Ambient temperature range: –40°C to +125°C
- fSCK 1 MHz (MAX)
- Title
- Size:
- A4
- Number:
- Revision:
- Date:
- Time:
- Sheet
- of
- (in symbol BSP129H6327XTSA1) 2, 4

### Library data of the parts
C112 C122 C123 C129-C132 = CMP-00427-4: DNP cap 0402; Mounting Type: SM; Package: 0402 (1005 Metric); MPN: DNP
C113 C117-C119 C121 C124 C126 C133 C135 C136 = CMP-001-1980-2: as C59-C62 on sheet Accelerometers; Height max: 550µm; ComponentLink3Description: Digikey; Mounting Type: SM; ComponentLink3URL: https://www.digikey.com/en/products/detail/murata-electronics/GCM155L8EH104KE07D/11618823; Package: 0402 (1005 Metric); Lead Spacing: 0mm; MPN: GCM155L8EH104KE07D; Size: 1.00mm x 0.50mm; Ratings: AEC-Q200; ComponentLink1URL: https://www.murata.com/en-us/products/productdetail?partno=GCM155L8EH104KE07%23; ComponentLink1Description: Datasheet; Dielectric: X8L; ComponentLink2Description: Mouser; ComponentLink2URL: https://eu.mouser.com/ProductDetail/Murata-Electronics/GCM155L8EH104KE07D?qs=1mbolxNpo8fQSHf0HYnZWw%3D%3D
C114 C115 C125 C134 = CMP-001-2015-2: CAP CER 0.47UF 50V X8L 0805; Manufacturer: TDK Corporation; Op Temp min: -55°C; Tolerance: 10%; Op Temp max: 150°C; ComponentLink1Description: Datasheet; Size: 2.00mm x 1.25mm; Dielectric: X8L; ComponentLink3URL: https://www.digikey.com/en/products/detail/tdk-corporation/CGA4J1X8L1H474K125AC/12807037?s=N4IgjCBcoKxaBjKAzAhgGwM4FMA0IB7KAbRAGYYAWAdgA5KQBdfABwBcoQBlNgJwEsAdgHMQAX3xgG0EEkhoseQiRAAmMrWoamrDpG58hoieABs8WSgw58RSKTIBOMqsc6Q7TjwEjx%2BU24ycgo2yvYglAAMjpRg5sweegY%2BxviqMKoWwdZKdqSqlK5kEGmFztQgpa6xlWpllLTunvreRn7gjrSBiFaKtiqRTCaqkZTdlvI5-eGRAHQ0AAQArQBitTSRC4JrCc0gAKqC-GwA8sgAstiomACuvNjtALSZQVB8N7kqcPhujCaP4zk70%2B4QgfzEYiAA; Ratings: AEC-Q200; ComponentLink3Description: Digikey; ComponentLink2Description: Mouser; Mounting Type: SM; Lead Spacing: 0mm; ComponentLink1URL: https://product.tdk.com/en/search/capacitor/ceramic/mlcc/info?part_no=CGA4J1X8L1H474K125AC; MPN: CGA4J1X8L1H474K125AC; Height max: 1.45mm; ComponentLink2URL: https://eu.mouser.com/ProductDetail/TDK/CGA4J1X8L1H474K125AC?qs=W%2FMpXkg%252BdQ5d8zdfD6mokw%3D%3D; Package: 0805 (2012 Metric)
C116 = CMP-001-2007-2: CAP CER 0.033UF 50V X8L 0402; Manufacturer: Murata Electronics; Op Temp max: 150°C; Tolerance: 10%; Op Temp min: -55°C; ComponentLink1URL: https://www.murata.com/en-us/products/productdetail?partno=GCM155L8EH333KE07%23; Mounting Type: SM; Dielectric: X8L; ComponentLink3URL: https://www.digikey.com/en/products/detail/murata-electronics/GCM155L8EH333KE07D/17845188; Size: 1.00mm x 0.50mm; ComponentLink1Description: Datasheet; ComponentLink3Description: Digikey; Package: 0402 (1005 Metric); MPN: GCM155L8EH333KE07D; ComponentLink2Description: Mouser; Height max: 550µm; Lead Spacing: 0mm; ComponentLink2URL: https://eu.mouser.com/ProductDetail/Murata-Electronics/GCM155L8EH333KE07D?qs=rrS6PyfT74cZK6FfR7MiFw%3D%3D; Ratings: AEC-Q200
C120 C137 = CMP-001-2014-2: CAP CER 330PF 16V X8R 0603; Manufacturer: KEMET; Op Temp max: 150°C; Tolerance: 5%; Op Temp min: -55°C; ComponentLink2URL: https://eu.mouser.com/ProductDetail/KEMET/C0603C331J4HACTU?qs=W0yvOO0ixfGIN%252BOCnjHNiQ%3D%3D; MPN: C0603C331J4HACTU; Ratings: -; Height max: 870µm; ComponentLink1Description: Datasheet; ComponentLink3URL: https://www.digikey.com/en/products/detail/kemet/C0603C331J4HACTU/7946553?s=N4IgjCBcpgLFoDGUBmBDANgZwKYBoQB7KAbXAAYAOAdlgCYQBdAgBwBcoQBlNgJwEsAdgHMQAXwJ0ArA2ghkkdNnxFSIOvQCcAZgjMQ7TjwEjxBMJsqaE81JlwFikMuSYT15WNbkKlD1c4g2trkAAQsAGJMrByQIACqgvxsAPIoALI4aFgArrw4ZiAAtLJIUHw5Kk5kUiAE1ozuRd5lkBVVanpi3UA; Size: 1.60mm x 0.80mm; ComponentLink2Description: Mouser; Package: 0603 (1608 Metric); ComponentLink3Description: Digikey; Lead Spacing: 0mm; Mounting Type: SM; Dielectric: X8R; ComponentLink1URL: https://www.kemet.com/en/us/product/C0603C331J4HACTU.html
C127 C128 C138 C139 = CMP-001-2016-2: CAP CER 0.047UF 16V X8R 0402; Manufacturer: TDK Corporation; Op Temp min: -55°C; Op Temp max: 150°C; Tolerance: 10%; Lead Spacing: 0mm; ComponentLink2Description: Mouser; ComponentLink2URL: https://eu.mouser.com/ProductDetail/TDK/CGA2B3X8R1C473K050BB?qs=7GgVL%252Bg%252BDME3TQb%252Bbj%2FjaA%3D%3D; ComponentLink1Description: Datasheet; ComponentLink3URL: https://www.digikey.com/en/products/detail/tdk-corporation/CGA2B3X8R1C473K050BB/3949531; Dielectric: X8R; ComponentLink3Description: Digikey; Height max: 550µm; ComponentLink1URL: https://product.tdk.com/en/search/capacitor/ceramic/mlcc/info?part_no=CGA2B3X8R1C473K050BB; MPN: CGA2B3X8R1C473K050BB; Ratings: AEC-Q200; Size: 1.00mm x 0.50mm; Package: 0402 (1005 Metric); Mounting Type: SM
Q7 = BSP129H6327XTSA1: MOSFET N-CH 240V 350MA SOT223-4; Manufacturer: Infineon Technologies; Current - Continuous Drain (Id) @ 25°C: 350mA (Ta); Drive Voltage (Max Rds On, Min Rds On): 0V, 10V; Rds On (Max) @ Id, Vgs: 6Ohm @ 350mA, 10V; Vgs(th) (Max) @ Id: 1V @ 108µA; Gate Charge (Qg) (Max) @ Vgs: 5.7 nC @ 5 V; Vgs (Max): ±20V; Input Capacitance (Ciss) (Max) @ Vds: 108 pF @ 25 V; Power Dissipation (Max): 1.8W (Ta); Qualification: AEC-Q101; MPN: BSP129H6327XTSA1; Drain to Source Voltage (Vdss): 240 V; ComponentLink1Description: Datasheet; ComponentLink1URL: https://www.infineon.com/assets/row/public/documents/24/49/infineon-bsp129-ds-en.pdf?fileId=db3a30433c1a8752013c1fc296d2395; Operating Temperature (MIN): -55°C (TJ); Operating Temperature (MAX): +150°C (TJ); Mounting Type: SM; Package / Case: TO-261-4, TO-261AA; ComponentLink2Description: DigiKey; ComponentLink2URL: https://www.digikey.com/en/products/detail/infineon-technologies/BSP129H6327XTSA1/5410101?s=N4IgTCBcDaIEIGUAKBGMBOAEgNgMxgHYANAFQQEEUQBdAXyA; ComponentLink3Description: Mouser; ComponentLink3URL: https://eu.mouser.com/ProductDetail/Infineon-Technologies/BSP129H6327XTSA1?qs=LqwxS8kK3AtD0Dk5QHkDTA%3D%3D
R161 R167 = CMP-001-0533-6: RES 510K OHM 1% 1/16W 0402; Manufacturer: YAGEO; Op Temp max: 155°C; Temperature Coefficient: ±100ppm; Op Temp min: -55°C; Power: 63mW; Package: 0402 (1005 Metric); Composition: Thick Film; Size: 1.00mm x 0.50mm; ComponentLink2Description: Mouser; MPN: RC0402FR-07510KL; Height max: 400µm; ComponentLink1URL: https://www.yageo.com/upload/media/product/productsearch/datasheet/rchip/PYu-RC_Group_51_RoHS_L_12.pdf; ComponentLink2URL: https://eu.mouser.com/ProductDetail/YAGEO/RC0402FR-07510KL?qs=V1yeUXFNrkkq0IeA5n8CcA%3D%3D; Tolerance: 1%; Mounting Type: SM; ComponentLink3Description: Digikey; ComponentLink3URL: https://www.digikey.com/en/products/detail/yageo/RC0402FR-07510KL/726631; Ratings: -; ComponentLink1Description: Datasheet
R162 R164 = CMP-00475-6: RES 31.6K OHM 1% 1/16W 0402; Manufacturer: YAGEO; Power: 63mW; Temperature Coefficient: ±100ppm; Op Temp max: 155°C; Op Temp min: -55°C; ComponentLink2Description: Mouser; Size: 1.00mm x 0.50mm; ComponentLink3URL: https://www.digikey.com/en/products/detail/yageo/RC0402FR-0731K6L/5280975; Composition: Thick Film; Mounting Type: SM; ComponentLink1URL: https://www.yageo.com/upload/media/product/productsearch/datasheet/rchip/PYu-RC_Group_51_RoHS_L_12.pdf; Tolerance: 1%; ComponentLink3Description: Digikey; MPN: RC0402FR-0731K6L; ComponentLink1Description: Datasheet; Ratings: -; ComponentLink2URL: https://eu.mouser.com/ProductDetail/YAGEO/RC0402FR-0731K6L?qs=tQYgeJ5sXdm2wsAqEjplmg%3D%3D; Package: 0402 (1005 Metric); Height max: 400µm
R163 R175 R290 = CMP-001-0927-2: as R104 on sheet Accelerometers; Height max: 550µm; ComponentLink2URL: https://eu.mouser.com/ProductDetail/YAGEO/RC0603FR-070RL?qs=0yPvnVz5%2FmpDQv43TwvCfw%3D%3D; Temperature Coefficient: -; ComponentLink3Description: Digikey; ComponentLink2Description: Mouser; MPN: RC0603FR-070RL; ComponentLink1URL: https://www.yageo.com/upload/media/product/productsearch/datasheet/rchip/PYu-RC_Group_51_RoHS_L_12.pdf; Ratings: -; Size: 1.60mm x 0.80mm; Composition: Thick Film; Mounting Type: SM; ComponentLink3URL: https://www.digikey.com/en/products/detail/yageo/RC0603FR-070RL/1304008; Package: 0603 (1608 Metric); ComponentLink1Description: Datasheet
R165 = CMP-001-0497-6: RES 110 OHM 1% 1/16W 0402; Manufacturer: YAGEO; Power: 63mW; Op Temp min: -55°C; Op Temp max: 155°C; Temperature Coefficient: ±100ppm; Size: 1.00mm x 0.50mm; ComponentLink1Description: Datasheet; Package: 0402 (1005 Metric); ComponentLink2URL: https://eu.mouser.com/ProductDetail/YAGEO/RC0402FR-07110RL?qs=QWYorlrD8IXj7iGvwWbRbA%3D%3D; MPN: RC0402FR-07110RL; ComponentLink3Description: Digikey; Height max: 400µm; Ratings: -; ComponentLink3URL: https://www.digikey.com/en/products/detail/yageo/RC0402FR-07110RL/2827583; Composition: Thick Film; ComponentLink2Description: Mouser; Tolerance: 1%; Mounting Type: SM; ComponentLink1URL: https://www.yageo.com/upload/media/product/productsearch/datasheet/rchip/PYu-RC_Group_51_RoHS_L_12.pdf
R166 R169 R170 R176 R181 R183 R186 = CMP-001-0920-3: DNP res 0603; Mounting Type: SM; MPN: DNP; Package: 0603 (1608 Metric)
R168 = CMP-001-0277-7: as R96-R98 on sheet Accelerometers; ComponentLink1URL: https://www.yageo.com/upload/media/product/productsearch/datasheet/rchip/PYu-RC_Group_51_RoHS_L_12.pdf; ComponentLink1Description: Datasheet; MPN: RC0402FR-0747K5L; ComponentLink3Description: Digikey; ComponentLink2URL: https://eu.mouser.com/ProductDetail/YAGEO/RC0402FR-0747K5L?qs=V1yeUXFNrklfu86Rfgihxg%3D%3D; Mounting Type: SM; Tolerance: 1%; Package: 0402 (1005 Metric); Height max: 400µm; ComponentLink2Description: Mouser; ComponentLink3URL: https://www.digikey.com/en/products/detail/yageo/RC0402FR-0747K5L/726617; Size: 1.00mm x 0.50mm; Composition: Thick Film; Ratings: -
R171-R174 = CMP-001-0482-4: as R99-R102 on sheet Accelerometers; Ratings: -; ComponentLink3URL: https://www.digikey.com/en/products/detail/yageo/RC0402FR-0722RL/726562; ComponentLink2URL: https://eu.mouser.com/ProductDetail/YAGEO/RC0402FR-0722RL?qs=V1yeUXFNrkkRg6zf08ADKQ%3D%3D; MPN: RC0402FR-0722RL; ComponentLink1Description: Datasheet; ComponentLink3Description: Digikey; Tolerance: 1%; Size: 1.00mm x 0.50mm; ComponentLink1URL: https://www.yageo.com/upload/media/product/productsearch/datasheet/rchip/PYu-RC_Group_51_RoHS_L_12.pdf; Composition: Thick Film; ComponentLink2Description: Mouser; Mounting Type: SM; Package: 0402 (1005 Metric); Height max: 400µm
R177 R179 R184 R185 = CMP-001-0515-6: RES 43K OHM 1% 1/16W 0402; Manufacturer: YAGEO; Op Temp min: -55°C; Temperature Coefficient: ±100ppm; Power: 63mW; Op Temp max: 155°C; Size: 1.00mm x 0.50mm; Package: 0402 (1005 Metric); ComponentLink3URL: https://www.digikey.com/en/products/detail/yageo/RC0402FR-0743KL/726609; ComponentLink1Description: Datasheet; Composition: Thick Film; Mounting Type: SM; Height max: 400µm; ComponentLink2URL: https://eu.mouser.com/ProductDetail/YAGEO/RC0402FR-0743KL?qs=Is6ZsIPfHkZH7Q2ies02Tw%3D%3D; ComponentLink1URL: https://www.yageo.com/upload/media/product/productsearch/datasheet/rchip/PYu-RC_Group_51_RoHS_L_12.pdf; Ratings: -; ComponentLink2Description: Mouser; MPN: RC0402FR-0743KL; ComponentLink3Description: Digikey; Tolerance: 1%
R180 R182 = CMP-00010-6: RES 10K OHM 1% 1/16W 0402; Manufacturer: YAGEO; Op Temp max: 155°C; Op Temp min: -55°C; Power: 63mW; Temperature Coefficient: ±100ppm; ComponentLink3URL: https://www.digikey.com/en/products/detail/yageo/RC0402FR-0710KL/726523; ComponentLink1Description: Datasheet; Height max: 400µm; ComponentLink3Description: Digikey; ComponentLink2URL: https://www2.mouser.com/ProductDetail/YAGEO/RC0402FR-0710KL?qs=%2Fha2pyFaduhjtLcYvKXQ8NAGbRXkQ%2Fwl6RsvWHeV66MSeqLhkcF3rg%3D%3D; Ratings: -; MPN: RC0402FR-0710KL; ComponentLink1URL: https://www.yageo.com/upload/media/product/productsearch/datasheet/rchip/PYu-RC_Group_51_RoHS_L_12.pdf; ComponentLink2Description: Mouser; Mounting Type: SM; Tolerance: 1%; Composition: Thick Film; Size: 1.00mm x 0.50mm; Package: 0402 (1005 Metric)
TP21 TP22 TP24 TP27 = TP_0.75: Test point 0.75mm
TP23 TP25 TP26 TP90 TP91 = TP_1.5
U27 = ALM2403QPWPRQ1: IC OPAMP GP 2 CIRCUIT 14HTSSOP; Manufacturer: Texas Instruments; MPN: ALM2403QPWPRQ1
U28 = PGA970QPHPR: IC SGNL CONDITIONER LVDT 48HTQFP; Manufacturer: Texas Instruments; MPN: PGA970QPHPR